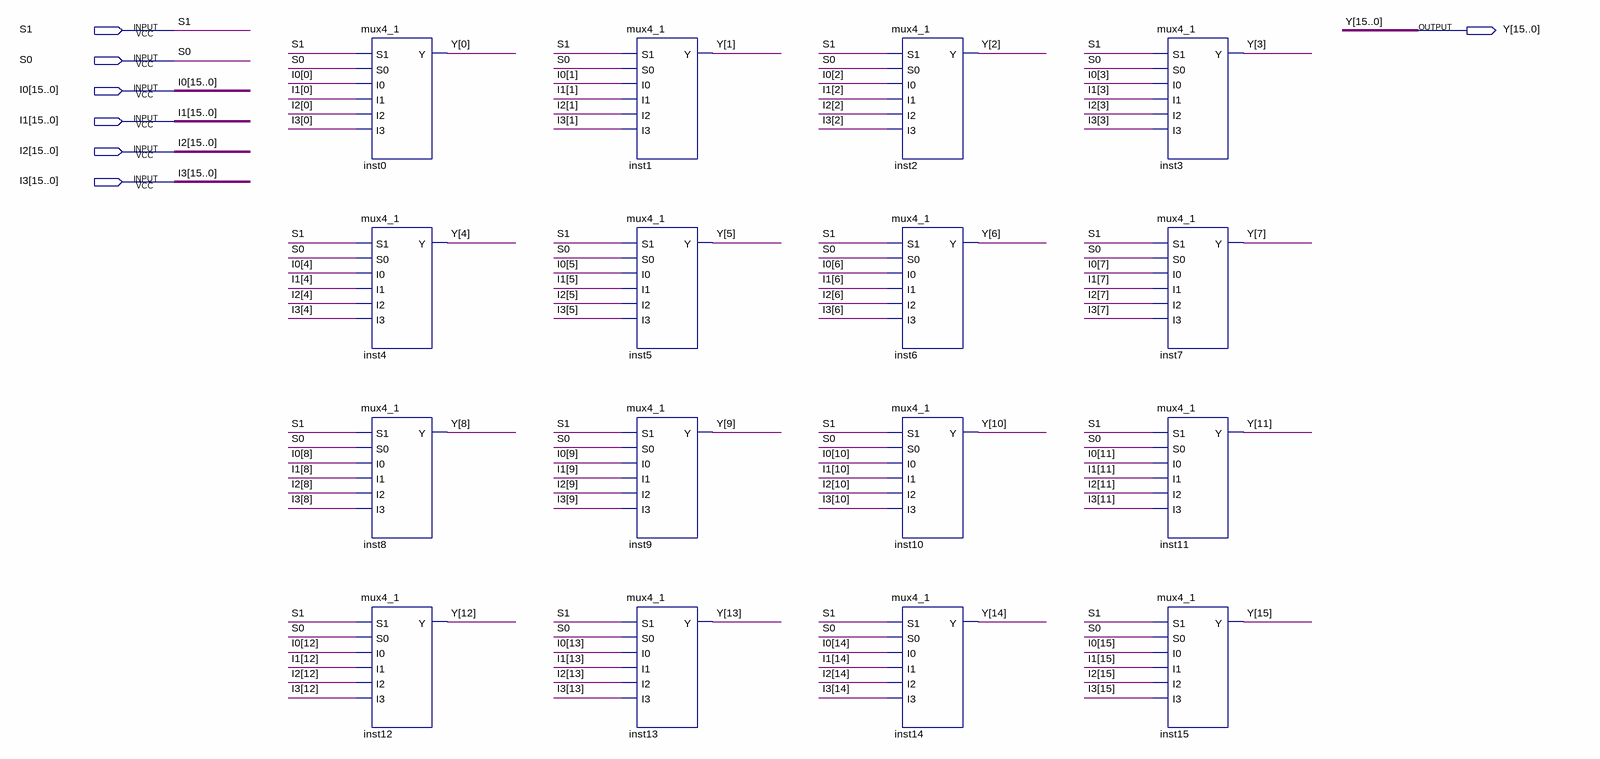
[diagram p0: schematic sheet]
// Quartus schematic mux4_1_16bit.bdf as structural Verilog: 16 symbols, 7 pins
module mux4_1_16bit (
  input  S1,
  input  S0,
  input  [15:0] I0,
  input  [15:0] I1,
  input  [15:0] I2,
  input  [15:0] I3,
  output [15:0] Y
);

  mux4_1 inst0 (.S1(S1), .S0(S0), .I0(I0[0]), .I1(I1[0]), .I2(I2[0]), .I3(I3[0]), .Y(Y[0]));
  mux4_1 inst4 (.S1(S1), .S0(S0), .I0(I0[4]), .I1(I1[4]), .I2(I2[4]), .I3(I3[4]), .Y(Y[4]));
  mux4_1 inst8 (.S1(S1), .S0(S0), .I0(I0[8]), .I1(I1[8]), .I2(I2[8]), .I3(I3[8]), .Y(Y[8]));
  mux4_1 inst12 (.S1(S1), .S0(S0), .I0(I0[12]), .I1(I1[12]), .I2(I2[12]), .I3(I3[12]), .Y(Y[12]));
  mux4_1 inst1 (.S1(S1), .S0(S0), .I0(I0[1]), .I1(I1[1]), .I2(I2[1]), .I3(I3[1]), .Y(Y[1]));
  mux4_1 inst5 (.S1(S1), .S0(S0), .I0(I0[5]), .I1(I1[5]), .I2(I2[5]), .I3(I3[5]), .Y(Y[5]));
  mux4_1 inst9 (.S1(S1), .S0(S0), .I0(I0[9]), .I1(I1[9]), .I2(I2[9]), .I3(I3[9]), .Y(Y[9]));
  mux4_1 inst13 (.S1(S1), .S0(S0), .I0(I0[13]), .I1(I1[13]), .I2(I2[13]), .I3(I3[13]), .Y(Y[13]));
  mux4_1 inst2 (.S1(S1), .S0(S0), .I0(I0[2]), .I1(I1[2]), .I2(I2[2]), .I3(I3[2]), .Y(Y[2]));
  mux4_1 inst6 (.S1(S1), .S0(S0), .I0(I0[6]), .I1(I1[6]), .I2(I2[6]), .I3(I3[6]), .Y(Y[6]));
  mux4_1 inst10 (.S1(S1), .S0(S0), .I0(I0[10]), .I1(I1[10]), .I2(I2[10]), .I3(I3[10]), .Y(Y[10]));
  mux4_1 inst14 (.S1(S1), .S0(S0), .I0(I0[14]), .I1(I1[14]), .I2(I2[14]), .I3(I3[14]), .Y(Y[14]));
  mux4_1 inst3 (.S1(S1), .S0(S0), .I0(I0[3]), .I1(I1[3]), .I2(I2[3]), .I3(I3[3]), .Y(Y[3]));
  mux4_1 inst7 (.S1(S1), .S0(S0), .I0(I0[7]), .I1(I1[7]), .I2(I2[7]), .I3(I3[7]), .Y(Y[7]));
  mux4_1 inst11 (.S1(S1), .S0(S0), .I0(I0[11]), .I1(I1[11]), .I2(I2[11]), .I3(I3[11]), .Y(Y[11]));
  mux4_1 inst15 (.S1(S1), .S0(S0), .I0(I0[15]), .I1(I1[15]), .I2(I2[15]), .I3(I3[15]), .Y(Y[15]));
endmodule
